# Altium schematic sheet Sheet2.SchDoc
size B; DrawnBy: DMK; DocumentNumber: 3; Revision: A; SheetNumber: 2; SheetTotal: 3
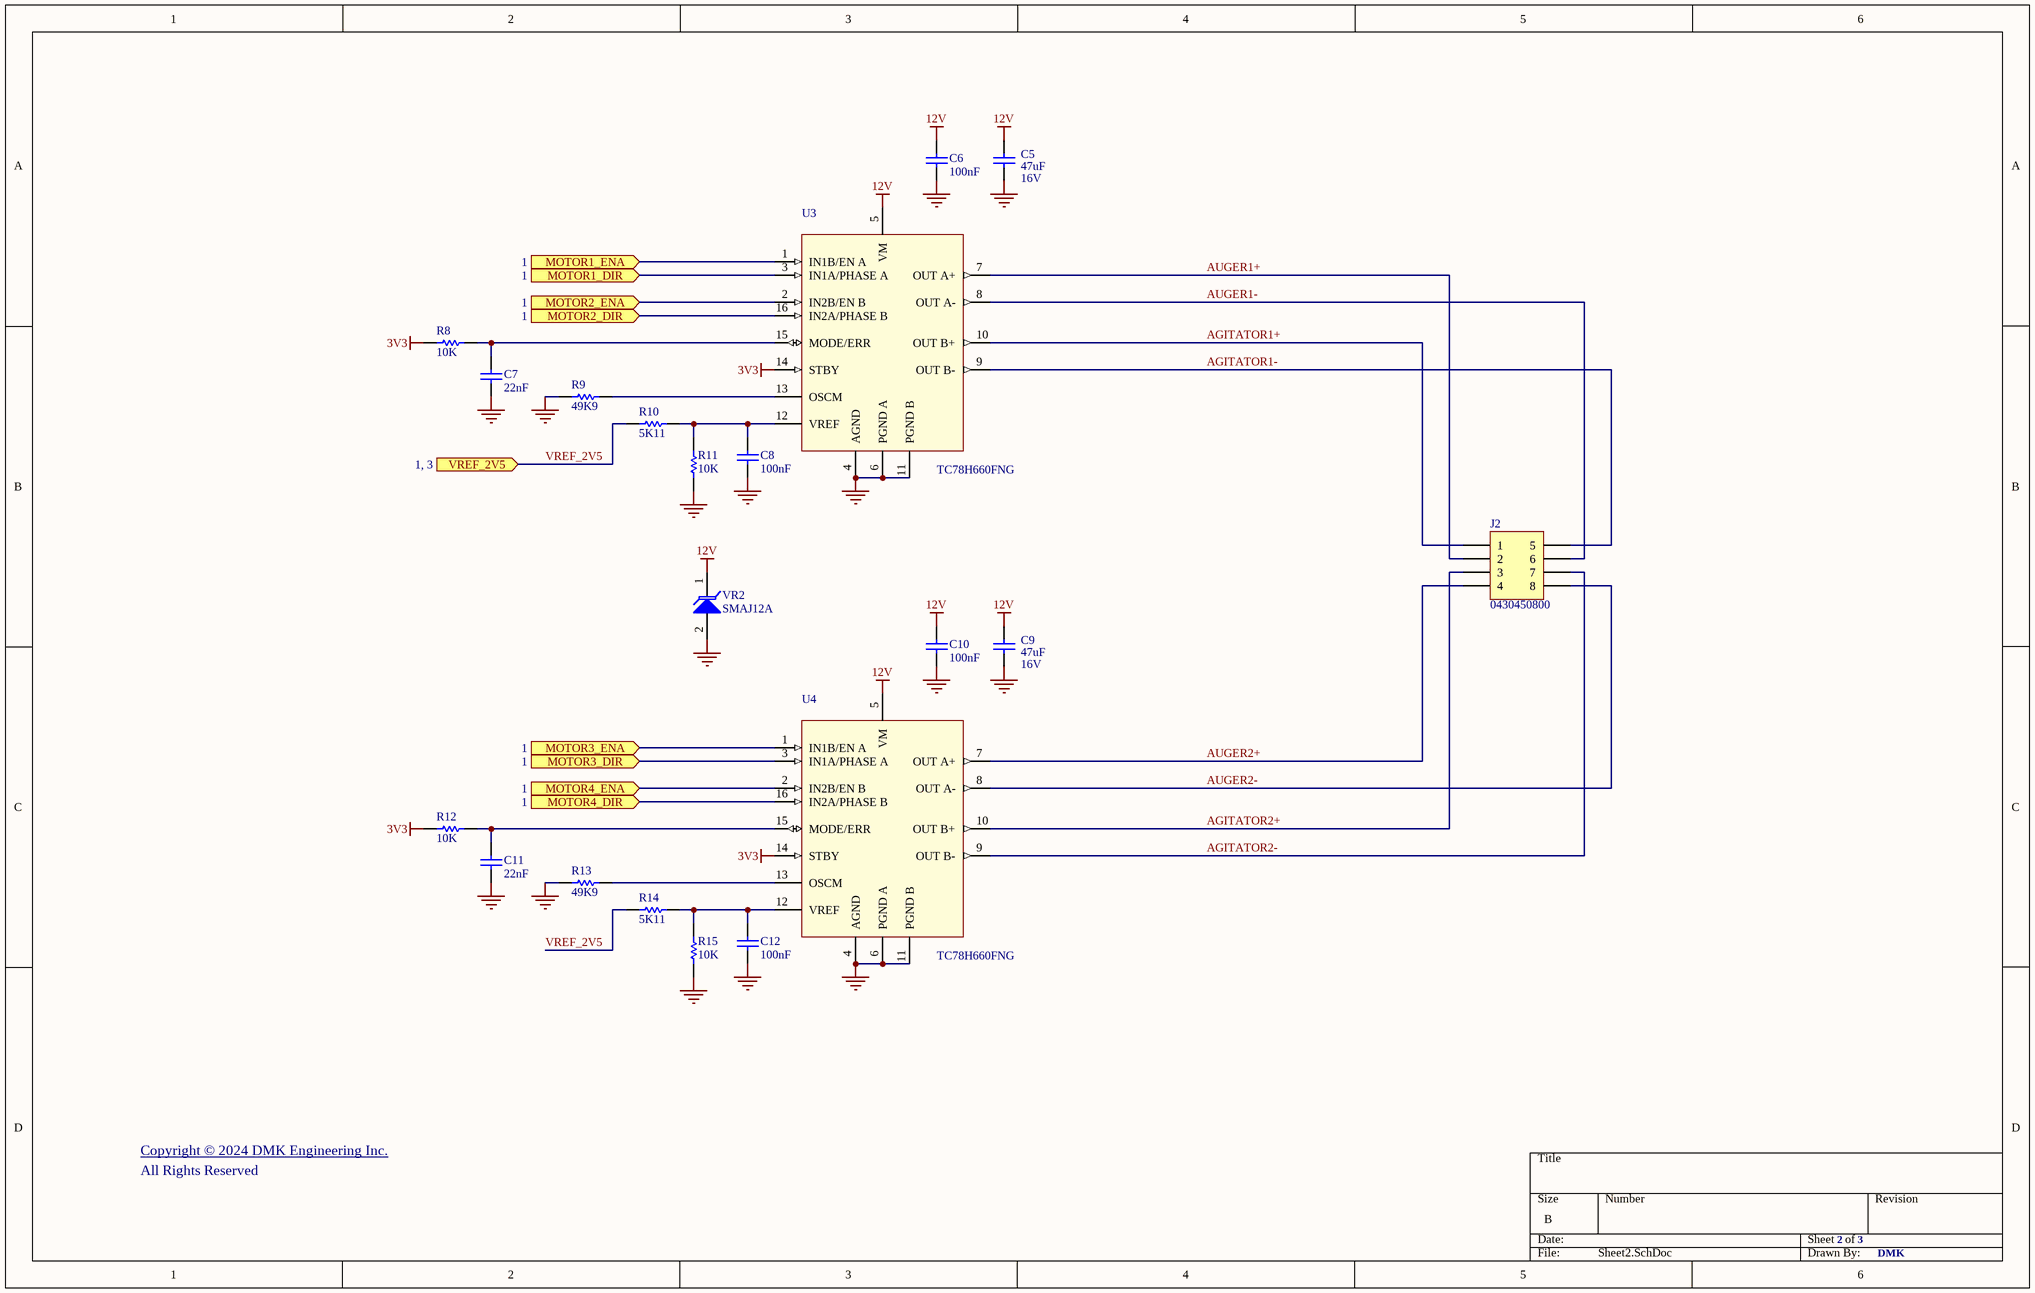
[diagram p0: Sheet2.SchDoc]

## Parts
C5  47uF  Voltage Rating: 16V  [C_1210]
C6  100nF  [C_0603]
C7  22nF  [C_0603]
C8  100nF  [C_0603]
C9  47uF  Voltage Rating: 16V  [C_1210]
C10  100nF  [C_0603]
C11  22nF  [C_0603]
C12  100nF  [C_0603]
J2  Manufacturer Part Number: 0430450800  [MOLEX 43045-0800]  (hidden comment: Header 4X2A)
R8  10K  [R_0603]
R9  49K9  [R_0603]
R10  5K11  [R_0603]
R11  10K  [R_0603]
R12  10K  [R_0603]
R13  49K9  [R_0603]
R14  5K11  [R_0603]
R15  10K  [R_0603]
U3  TC78H660FNG  [TSSOP-16]
U4  TC78H660FNG  [TSSOP-16]
VR2  SMAJ12A  [DO-214AC (SMA)]

## Ports
MOTOR1_DIR (in, see 1), MOTOR1_ENA (in, see 1), MOTOR2_DIR (in, see 1), MOTOR2_ENA (in, see 1), MOTOR3_DIR (in, see 1), MOTOR3_ENA (in, see 1), MOTOR4_DIR (in, see 1), MOTOR4_ENA (in, see 1), VREF_2V5 (in, see 1, 3)

## Nets
3V3: R8.1 R12.1 U3.14(STBY) U4.14(STBY)
12V: C5.2 C6.2 C9.2 C10.2 U3.5(VM) U4.5(VM) VR2.1(K)
GND: C5.1 C6.1 C7.1 C8.1 C9.1 C10.1 C11.1 C12.1 R9.2 R11.1 R13.2 R15.1 U3.4(AGND) U3.6(PGND_A) U3.11(PGND_B) U4.4(AGND) U4.6(PGND_A) U4.11(PGND_B) VR2.2(A)
AGITATOR1+: J2.1 U3.10(OUT_B+)
AGITATOR1-: J2.5 U3.9(OUT_B-)
AGITATOR2+: J2.3 U4.10(OUT_B+)
AGITATOR2-: J2.7 U4.9(OUT_B-)
AUGER1+: J2.2 U3.7(OUT_A+)
AUGER1-: J2.6 U3.8(OUT_A-)
AUGER2+: J2.4 U4.7(OUT_A+)
AUGER2-: J2.8 U4.8(OUT_A-)
MOTOR1_DIR: U3.3(IN1A/PHASE_A) ; port MOTOR1_DIR
MOTOR1_ENA: U3.1(IN1B/EN_A) ; port MOTOR1_ENA
MOTOR2_DIR: U3.16(IN2A/PHASE_B) ; port MOTOR2_DIR
MOTOR2_ENA: U3.2(IN2B/EN_B) ; port MOTOR2_ENA
MOTOR3_DIR: U4.3(IN1A/PHASE_A) ; port MOTOR3_DIR
MOTOR3_ENA: U4.1(IN1B/EN_A) ; port MOTOR3_ENA
MOTOR4_DIR: U4.16(IN2A/PHASE_B) ; port MOTOR4_DIR
MOTOR4_ENA: U4.2(IN2B/EN_B) ; port MOTOR4_ENA
VREF_2V5: R10.1 R14.1 ; port VREF_2V5
NetC7_2: C7.2 R8.2 U3.15(MODE/ERR)
NetC8_2: C8.2 R10.2 R11.2 U3.12(VREF)
NetC11_2: C11.2 R12.2 U4.15(MODE/ERR)
NetC12_2: C12.2 R14.2 R15.2 U4.12(VREF)
NetR9_1: R9.1 U3.13(OSCM)
NetR13_1: R13.1 U4.13(OSCM)

## Notes on the sheet
- Copyright © 2024 DMK Engineering Inc. <www.dmkeng.com>
- All Rights Reserved

## Library data of the parts
C5 C9 = CAP: Multilayer Ceramic Capacitor, 47 uF, 16 V, ± 10%, X5R, 1210 [3225 Metric]; Manufacturer: Samsung; Manufacturer Part Number: CL32A476KOJNNNE; Material: 4241ConductorMaterial; Capacitance: 47uF; Supplier 1: Mouser; Supplier Part Number 1: 187-CL32A476KOJNNNE; RoHS: Yes; Category: Ceramic Capacitors; Stock 1: 246355; Pricing 1: 1=0.65, 10=0.386, 50=0.386, 100=0.249, 1000=0.204, 2000=0.185, 10000=0.168, 25000=0.164, 50000=0.161 (USD); Mounting Technology: Surface Mount; Case/Package: 1210; Case Code (Metric): 3225; Case Code (Imperial): 1210; Min Operating Temperature: -55°C; Max Operating Temperature: 85°C; Package Quantity: 1; Packaging: Cut Tape; Value: 47uF; Tolerance: 10%; Voltage Rating (DC): 16V; Series: CL; Dielectric: X5R; Length: 0.126inch; Width: 0.098inch; Height: 2.8mm; Thickness: 0.106inch; Lead Free: Lead Free; RoHS Compliant: Yes; ComponentLink1URL: https://datasheet.ciiva.com/25785/cl32a476kojnnne-25785873.pdf?src-supplier=Digikey; ComponentLink1Description: https://datasheet.ciiva.com/25785/cl32a476kojnnne-25785873.pdf?src-supplier=Digikey
C6 C8 C10 C12 = CAP: CAP CER 0.1UF 50V X7R 0603; Manufacturer: Samsung; Manufacturer Part Number: CL10B104KB8NNWC; Tolerance: 10%; Capacitance: 100nF; Supplier 1: Mouser; Supplier Part Number 1: 187-CL10B104KB8NNWC; RoHS: Yes; Category: Ceramic Capacitors; Stock 1: 581862; Pricing 1: 1=0.1, 10=0.009, 50=0.009, 100=0.006, 1000=0.005, 10000=0.003 (USD); Mounting Technology: Surface Mount; Case/Package: 0603; Case Code (Metric): 1608; Case Code (Imperial): 0603; Min Operating Temperature: -55°C; Max Operating Temperature: 125°C; Package Quantity: 1; Packaging: Cut Tape; Value: 100nF; Voltage Rating: 50V; Series: CL; Length: 0.063inch; Width: 0.031inch; Thickness: 0.035inch; RoHS Compliant: Yes; ComponentLink1URL: https://datasheet.ciiva.com/25740/cl10b104kb8nnwc-25740227.pdf?src-supplier=Digikey; ComponentLink1Description: https://datasheet.ciiva.com/25740/cl10b104kb8nnwc-25740227.pdf?src-supplier=Digikey
C7 C11 = CAP: Multilayer Ceramic Capacitor, 0.022 uF, 50 V, ± 10%, X7R, 0603 [1608 Metric]; Manufacturer: Samsung; Manufacturer Part Number: CL10B223KB8NNNC; Voltage Rating (DC): 50V; Capacitance: 22nF; Supplier 1: Mouser; Supplier Part Number 1: 187-CL10B223KB8NNNC; RoHS: Yes; Category: Ceramic Capacitors; Stock 1: 72426; Pricing 1: 1=0.1, 10=0.015, 50=0.015, 100=0.011, 1000=0.009, 10000=0.006 (USD); Mounting Technology: Surface Mount; Case/Package: 0603; Case Code (Metric): 1608; Case Code (Imperial): 0603; Material: Ceramic; Min Operating Temperature: -55°C; Max Operating Temperature: 125°C; Value: 22nF; Tolerance: 10%; Dielectric: X7R; Package Quantity: 1; Packaging: Tape and Reel; Voltage Rating: 50V; Voltage: 50V; Series: CL; Construction: Flat; Length: 1.6mm; Width: 0.031inch; Height: 0.8mm; Thickness: 0.035inch; Depth: 0.8mm; Radiation Hardening: No; Lead Free: Lead Free; RoHS Compliant: Yes; ComponentLink1URL: https://datasheet.ciiva.com/25802/cl10b223kb8nnnc-25802289.pdf?src-supplier=Digikey; ComponentLink1Description: https://datasheet.ciiva.com/25802/cl10b223kb8nnnc-25802289.pdf?src-supplier=Digikey; ComponentLink2URL: https://datasheet.ciiva.com/26838/getdatasheetpartid-357419-26838449.pdf?src-supplier=Verical; ComponentLink2Description: https://datasheet.ciiva.com/26838/getdatasheetpartid-357419-26838449.pdf?src-supplier=Verical; ComponentLink3URL: https://datasheet.ciiva.com/29198/457190-da-01-en-vs-kondensator-0603-29198760.pdf?src-supplier=Conrad; ComponentLink3Description: https://datasheet.ciiva.com/29198/457190-da-01-en-vs-kondensator-0603-29198760.pdf?src-supplier=Conrad; ComponentLink4URL: https://datasheet.ciiva.com/26310/mlcc-catalogdownload2013-eng-26310316.pdf?src-supplier=Distrelec; ComponentLink4Description: https://datasheet.ciiva.com/26310/mlcc-catalogdownload2013-eng-26310316.pdf?src-supplier=Distrelec; ComponentLink5URL: https://datasheet.ciiva.com/16318/cl05b104kq5nnnc-16318246.pdf?src-supplier=Future+Electronics; ComponentLink5Description: https://datasheet.ciiva.com/16318/cl05b104kq5nnnc-16318246.pdf?src-supplier=Future+Electronics
J2 = Header 4X2A: Connector Wire to Board Header 8 Position 3mm Solder Right Angle Thru-Hole Tray; Manufacturer: Molex; Contact Resistance: 10mR; Max Voltage Rating (AC): 250V; LatestRevisionDate: 17-Jul-2002; LatestRevisionNote: Re-released for DXP Platform.; Publisher: Altium Limited; Supplier 1: Mouser; Supplier Part Number 1: 538-43045-0800; RoHS: Yes; Stock 1: 6399; Pricing 1: 1=2.63, 10=2.01, 50=2.01, 100=1.83, 1000=1.83, 10000=1.83, 10080=1.04 (USD); Contact Plating: Tin; Contact Material: Brass; Housing Color: Black; Housing Material: Polymer; Min Operating Temperature: -40°C; Max Operating Temperature: 105°C; Packaging: Tray; Number of Rows: 2; Termination: Solder; Orientation: Right Angle; Length: 16.15mm; Pitch: 3mm; Depth: 12.2mm; Flammability Rating: UL94 V-0; RoHS Compliant: Yes
R8 R11 R12 R15 = CMP-2002-07535-1: SMD Chip Resistor, 10 kohm, ± 1%, 100 mW, 0603 [1608 Metric], Thick Film, Precision; Manufacturer: Panasonic; Manufacturer Part Number: ERJ-3EKF1002V; Value: 10kR; Power Rating: 100mW; Voltage Rating: 75V; Temperature Coefficient: 100ppm/°C; Resistance: 10K; Supplier 1: Mouser; Supplier Part Number 1: 667-ERJ-3EKF1002V; RoHS: Yes; Category: Chip SMD Resistors; Stock 1: 4766252; Pricing 1: 1=0.1, 10=0.02, 50=0.02, 100=0.012, 1000=0.009, 5000=0.006, 10000=0.006, 100000=0.005 (USD); Mounting Technology: Surface Mount; Case/Package: 0603; Pins: 2; Case Code (Metric): 1608; Case Code (Imperial): 0603; Contact Plating: Tin; Min Operating Temperature: -55°C; Max Operating Temperature: 155°C; Tolerance: 1%; Packaging: Tape and Reel; Package Quantity: 1; Resistor Type: Thick Film; Number of Terminations: 2; Termination: SMD/SMT; Max Power Dissipation: 100mW; Features: Automotive AEC-Q200; Series: ERJ; Technology: THICK FILM; Resistance Tolerance: 1%; Construction: Rectangular; Voltage Rating (DC): 75V; Length: 1.6mm; Width: 0.8mm; Height: 0.45mm; Depth: 0.8mm; Radiation Hardening: No; Reach SVHC Compliant: No; Military Standard: Not; RoHS Compliant: Yes; Lead Free: 5697LeadFree; ComponentLink1URL: https://datasheet.ciiva.com/16759/70260748-16759807.pdf?src-supplier=Allied+Electronics; ComponentLink1Description: https://datasheet.ciiva.com/16759/70260748-16759807.pdf?src-supplier=Allied+Electronics
R9 R13 = CMP-2002-07535-1: SMD Chip Resistor, 49.9 kOhm, ± 1%, 100 mW, 0603 [1608 Metric], Thick Film, General Purpose; Manufacturer: Vishay; Manufacturer Part Number: CRCW060349K9FKEC; Value: 49.9kR; Power Rating: 100mW; Temperature Coefficient: 100ppm/°C; Voltage Rating: 75V; Resistance: 49K9; Supplier 1: Mouser; Supplier Part Number 1: 71-CRCW060349K9FKEC; RoHS: Yes; Category: Chip SMD Resistors; Stock 1: 47154; Pricing 1: 1=0.1, 10=0.017, 50=0.017, 100=0.01, 1000=0.007, 10000=0.004 (USD); Mounting Technology: Surface Mount; Case/Package: 0603; Contact Plating: Tin; Min Operating Temperature: -55°C; Max Operating Temperature: 155°C; Tolerance: 1%; Packaging: Tape and Reel; Package Quantity: 20000; Number of Terminations: 2; Max Power Dissipation: 100mW; Features: Automotive AEC-Q200; Series: CRCW; Construction: Rectangular; Length: 1.55mm; Width: 0.033inch; Height: 0.02inch; Depth: 0.85mm; Radiation Hardening: No; Military Standard: Not; Lead Free: Lead Free; RoHS Compliant: Yes; ComponentLink1URL: http://components.arrow.com/part/dataview/41404748S9458418N6892?src-supplier=Arrow+Electronics; ComponentLink1Description: http://components.arrow.com/part/dataview/41404748S9458418N6892?src-supplier=Arrow+Electronics; ComponentLink2URL: http://www.vishay.com/docs/20035/dcrcwe3.pdf?src-supplier=Avnet; ComponentLink2Description: http://www.vishay.com/docs/20035/dcrcwe3.pdf?src-supplier=Avnet; ComponentLink3URL: http://www.vishay.com/docs/20035/dcrcwe3.pdf?src-supplier=Digikey; ComponentLink3Description: http://www.vishay.com/docs/20035/dcrcwe3.pdf?src-supplier=Digikey; ComponentLink4URL: https://www.verical.com/server-webapp/html/getDatasheet?partID=52041&src-supplier=Verical; ComponentLink4Description: https://www.verical.com/server-webapp/html/getDatasheet?partID=52041&src-supplier=Verical
R10 R14 = CMP-2002-07535-1: Res Thick Film 0603 5.11K Ohm 1% 0.1W(1/10W) ±100ppm/C Pad SMD Automotive T/R; Manufacturer: Panasonic; Manufacturer Part Number: ERJ-3EKF5111V; Power Rating: 100mW; Value: 5.11kR; Voltage Rating: 75V; Temperature Coefficient: 100ppm/°C; Voltage Rating (DC): 50V; Resistance: 5K11; Supplier 1: Mouser; Supplier Part Number 1: 667-ERJ-3EKF5111V; RoHS: Yes; Category: Chip SMD Resistors; Stock 1: 209189; Pricing 1: 1=0.1, 10=0.02, 50=0.02, 100=0.012, 1000=0.008, 5000=0.005, 10000=0.005 (USD); Mounting Technology: Surface Mount; Case/Package: 0603; Case Code (Imperial): 0603; Case Code (Metric): 1608; Contact Plating: Tin; Min Operating Temperature: -55°C; Max Operating Temperature: 155°C; Tolerance: 1%; Packaging: Tape and Reel; Package Quantity: 1; Resistor Type: Thick Film; Number of Terminations: 2; Termination: SMD/SMT; Max Power Dissipation: 100mW; Features: Automotive AEC-Q200; Series: ERJ; Resistance Tolerance: 1%; Construction: Rectangular; Technology: THICK FILM; Length: 1.6mm; Width: 0.8mm; Height: 0.45mm; Depth: 0.8mm; Radiation Hardening: No; Reach SVHC Compliant: No; Military Standard: Not; Lead Free: Lead Free; RoHS Compliant: Yes; ComponentLink1URL: https://datasheet.ciiva.com/48531/aoa0000ce2-48531020.pdf?src-supplier=Avnet; ComponentLink1Description: https://datasheet.ciiva.com/48531/aoa0000ce2-48531020.pdf?src-supplier=Avnet; ComponentLink2URL: https://datasheet.ciiva.com/46389/426256-46389989.pdf?src-supplier=Element14; ComponentLink2Description: https://datasheet.ciiva.com/46389/426256-46389989.pdf?src-supplier=Element14; ComponentLink3URL: https://datasheet.ciiva.com/28695/1678782-28695818.pdf?src-supplier=Element14; ComponentLink3Description: https://datasheet.ciiva.com/28695/1678782-28695818.pdf?src-supplier=Element14; ComponentLink4URL: https://datasheet.ciiva.com/16770/70260748-16770758.pdf?src-supplier=Allied+Electronics; ComponentLink4Description: https://datasheet.ciiva.com/16770/70260748-16770758.pdf?src-supplier=Allied+Electronics
U3 U4 = TC78H660FNG: Dual H Bridge Driver IC 2.5V to 16V 16-Pin TSSOP; Manufacturer: Toshiba; Manufacturer Part Number: TC78H660FNG,EL; Supplier 1: Mouser; Supplier Part Number 1: 757-TC78H660FNGEL; RoHS: No; Stock 1: 15852; Pricing 1: 1=0.88, 10=0.779, 50=0.779, 100=0.653, 500=0.604, 1000=0.537, 2000=0.53, 4000=0.503, 8000=0.484, 10000=0.484, 24000=0.483 (USD)
VR2 = TVS Diode Unidirectional: 400 W 12 V Uni Directional Surface Mount Transient Voltage Suppressor Diode; Manufacturer: Vishay Semiconductors; Manufacturer Part Number: SMAJ12A-E3/61; Number of Elements: 1; Reverse Breakdown Voltage: 13.3V; Operating Supply Voltage: 12V; Max Surge Current: 20.1A; Breakdown Voltage: 14.7V; Clamping Voltage: 19.9V; Peak Pulse Power: 400W; Max Reverse Leakage Current: 1uA; Test Current: 1mA; Max Forward Surge Current (Ifsm): 40A; Current: 201A; Diode Type: ZENER; Power Line Protection: No; Supplier 1: Mouser; Supplier Part Number 1: 625-SMAJ12A-E3; RoHS: Yes; Category: TVS Diodes; Stock 1: 44832; Pricing 1: 1=0.42, 10=0.302, 50=0.302, 100=0.137, 1000=0.091, 1800=0.077, 9000=0.07, 10000=0.07, 23400=0.065, 48600=0.063 (USD); Case/Package: SMA; Pins: 2; Min Operating Temperature: -55°C; Max Operating Temperature: 150°C; Direction: Unidirectional; Package Quantity: 1800; Packaging: Tape and Reel; Reverse Standoff Voltage: 12V; Polarity: Unidirectional; Number of Channels: 1; Min Breakdown Voltage: 13.3V; Peak Pulse Current: 20.1A; Max Power Dissipation: 400W; Leakage Current: 1uA; Termination: SMD/SMT; Max Breakdown Voltage: 14.7V; Power Dissipation: 400W; Voltage Rating (DC): 12V; Voltage: 12V; Series: TransZorb®; Clamping Voltage-Max: 19.9V; Number of Unidirectional Channels: 1; Length: 4.5mm; Width: 2.79mm; Height: 2.09mm; Radiation Hardening: No; RoHS Compliant: Yes; Lead Free: Lead Free; Reach SVHC Compliant: Unknown; ComponentLink1URL: https://datasheet.ciiva.com/26322/548547-26322536.pdf?src-supplier=Element14; ComponentLink1Description: https://datasheet.ciiva.com/26322/548547-26322536.pdf?src-supplier=Element14; ComponentLink2URL: https://datasheet.ciiva.com/16199/smaj50a-16199669.pdf?src-supplier=Future+Electronics; ComponentLink2Description: https://datasheet.ciiva.com/16199/smaj50a-16199669.pdf?src-supplier=Future+Electronics; ComponentLink3URL: https://datasheet.ciiva.com/28409/548547-28409622.pdf?src-supplier=Element14; ComponentLink3Description: https://datasheet.ciiva.com/28409/548547-28409622.pdf?src-supplier=Element14